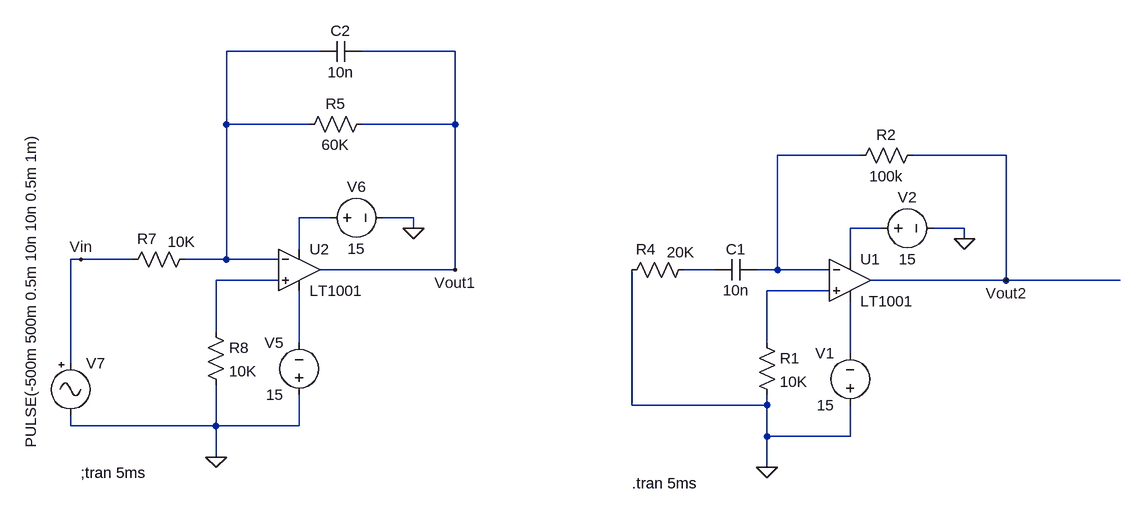
[diagram p0: schematic EXP4.5.asc]
EXP4.5.asc, the LTspice schematic file:
Version 4
SHEET 1 896 680
WIRE -624 -112 -768 -112
WIRE -416 -112 -560 -112
WIRE -768 0 -768 -112
WIRE -640 0 -768 0
WIRE -416 0 -416 -112
WIRE -416 0 -560 0
WIRE 208 48 80 48
WIRE 432 48 288 48
WIRE -608 144 -656 144
WIRE -480 144 -528 144
WIRE -480 160 -480 144
WIRE 240 160 192 160
WIRE 368 160 320 160
WIRE 368 176 368 160
WIRE -656 192 -656 144
WIRE -992 208 -1008 208
WIRE -912 208 -992 208
WIRE -768 208 -768 0
WIRE -768 208 -832 208
WIRE -688 208 -768 208
WIRE 192 208 192 160
WIRE -416 224 -416 0
WIRE -416 224 -624 224
WIRE -16 224 -64 224
WIRE 80 224 80 48
WIRE 80 224 48 224
WIRE 160 224 80 224
WIRE -688 240 -784 240
WIRE 432 240 432 48
WIRE 432 240 224 240
WIRE 608 240 432 240
WIRE 160 256 64 256
WIRE -784 320 -784 240
WIRE -656 336 -656 256
WIRE 64 336 64 256
WIRE 192 352 192 272
WIRE -1008 368 -1008 208
WIRE -144 432 -144 224
WIRE 64 432 64 416
WIRE 64 432 -144 432
WIRE -1008 464 -1008 448
WIRE -784 464 -784 400
WIRE -784 464 -1008 464
WIRE -656 464 -656 416
WIRE -656 464 -784 464
WIRE 64 480 64 432
WIRE 192 480 192 432
WIRE 192 480 64 480
WIRE -784 512 -784 464
WIRE 64 528 64 480
FLAG 64 528 0
FLAG 368 176 0
FLAG 432 240 Vout2
FLAG -784 512 0
FLAG -480 160 0
FLAG -416 224 Vout1
FLAG -992 208 Vin
SYMBOL voltage 192 448 R180
WINDOW 0 24 96 Left 2
WINDOW 3 24 16 Left 2
SYMATTR InstName V1
SYMATTR Value 15
SYMBOL opamps\\LT1001 192 176 R0
SYMATTR InstName U1
SYMBOL voltage 224 160 R270
WINDOW 0 32 56 VTop 2
WINDOW 3 -32 56 VBottom 2
SYMATTR InstName V2
SYMATTR Value 15
SYMBOL res 304 32 R90
WINDOW 0 0 56 VBottom 2
WINDOW 3 32 56 VTop 2
SYMATTR InstName R2
SYMATTR Value 100k
SYMBOL res -48 208 R90
WINDOW 0 0 74 VBottom 2
WINDOW 3 -27 21 VTop 2
SYMATTR InstName R4
SYMATTR Value 20K
SYMBOL res 48 320 R0
SYMATTR InstName R1
SYMATTR Value 10K
SYMBOL voltage -656 432 R180
WINDOW 0 24 96 Left 2
WINDOW 3 24 16 Left 2
SYMATTR InstName V5
SYMATTR Value 15
SYMBOL opamps\\LT1001 -656 160 R0
SYMATTR InstName U2
SYMBOL voltage -624 144 R270
WINDOW 0 32 56 VTop 2
WINDOW 3 -32 56 VBottom 2
SYMATTR InstName V6
SYMATTR Value 15
SYMBOL res -544 -16 R90
WINDOW 0 0 56 VBottom 2
WINDOW 3 32 56 VTop 2
SYMATTR InstName R5
SYMATTR Value 60K
SYMBOL res -816 192 R90
WINDOW 0 0 74 VBottom 2
WINDOW 3 -27 21 VTop 2
SYMATTR InstName R7
SYMATTR Value 10K
SYMBOL res -800 304 R0
SYMATTR InstName R8
SYMATTR Value 10K
SYMBOL Misc\\signal -1008 352 R0
WINDOW 3 -61 146 VLeft 2
WINDOW 123 0 0 Left 0
WINDOW 39 0 0 Left 0
SYMATTR Value PULSE(-500m 500m 0.5m 10n 10n 0.5m 1m)
SYMATTR InstName V7
SYMBOL cap -16 240 R270
WINDOW 0 32 32 VTop 2
WINDOW 3 0 32 VBottom 2
SYMATTR InstName C1
SYMATTR Value 10n
SYMBOL cap -560 -128 R90
WINDOW 0 0 32 VBottom 2
WINDOW 3 32 32 VTop 2
SYMATTR InstName C2
SYMATTR Value 10n
TEXT -144 552 Left 2 !.tran 5ms
TEXT -992 536 Left 2 !;tran 5ms

The netlist it stands for:
* EXP4.5.asc
V1 0 N009 15
XU1 N007 N002 N004 N009 Vout2 LT1001  ; pins In+ In- V+ V- OUT
V2 N004 0 15
R2 Vout2 N002 100k
R4 N005 0 20K
R1 N007 0 10K
V5 0 N008 15
XU2 N006 N001 N003 N008 Vout1 LT1001  ; pins In+ In- V+ V- OUT
V6 N003 0 15
R5 Vout1 N001 60K
R7 N001 Vin 10K
R8 N006 0 10K
V7 Vin 0 PULSE(-500m 500m 0.5m 10n 10n 0.5m 1m)
C1 N005 N002 10n
C2 Vout1 N001 10n
.tran 5ms
;tran 5ms
.lib LTC.lib
.backanno
.end